# EAGLE design ESP32S3_LoRa_ Camera_Board_050426 (EAGLE 6.5.0)
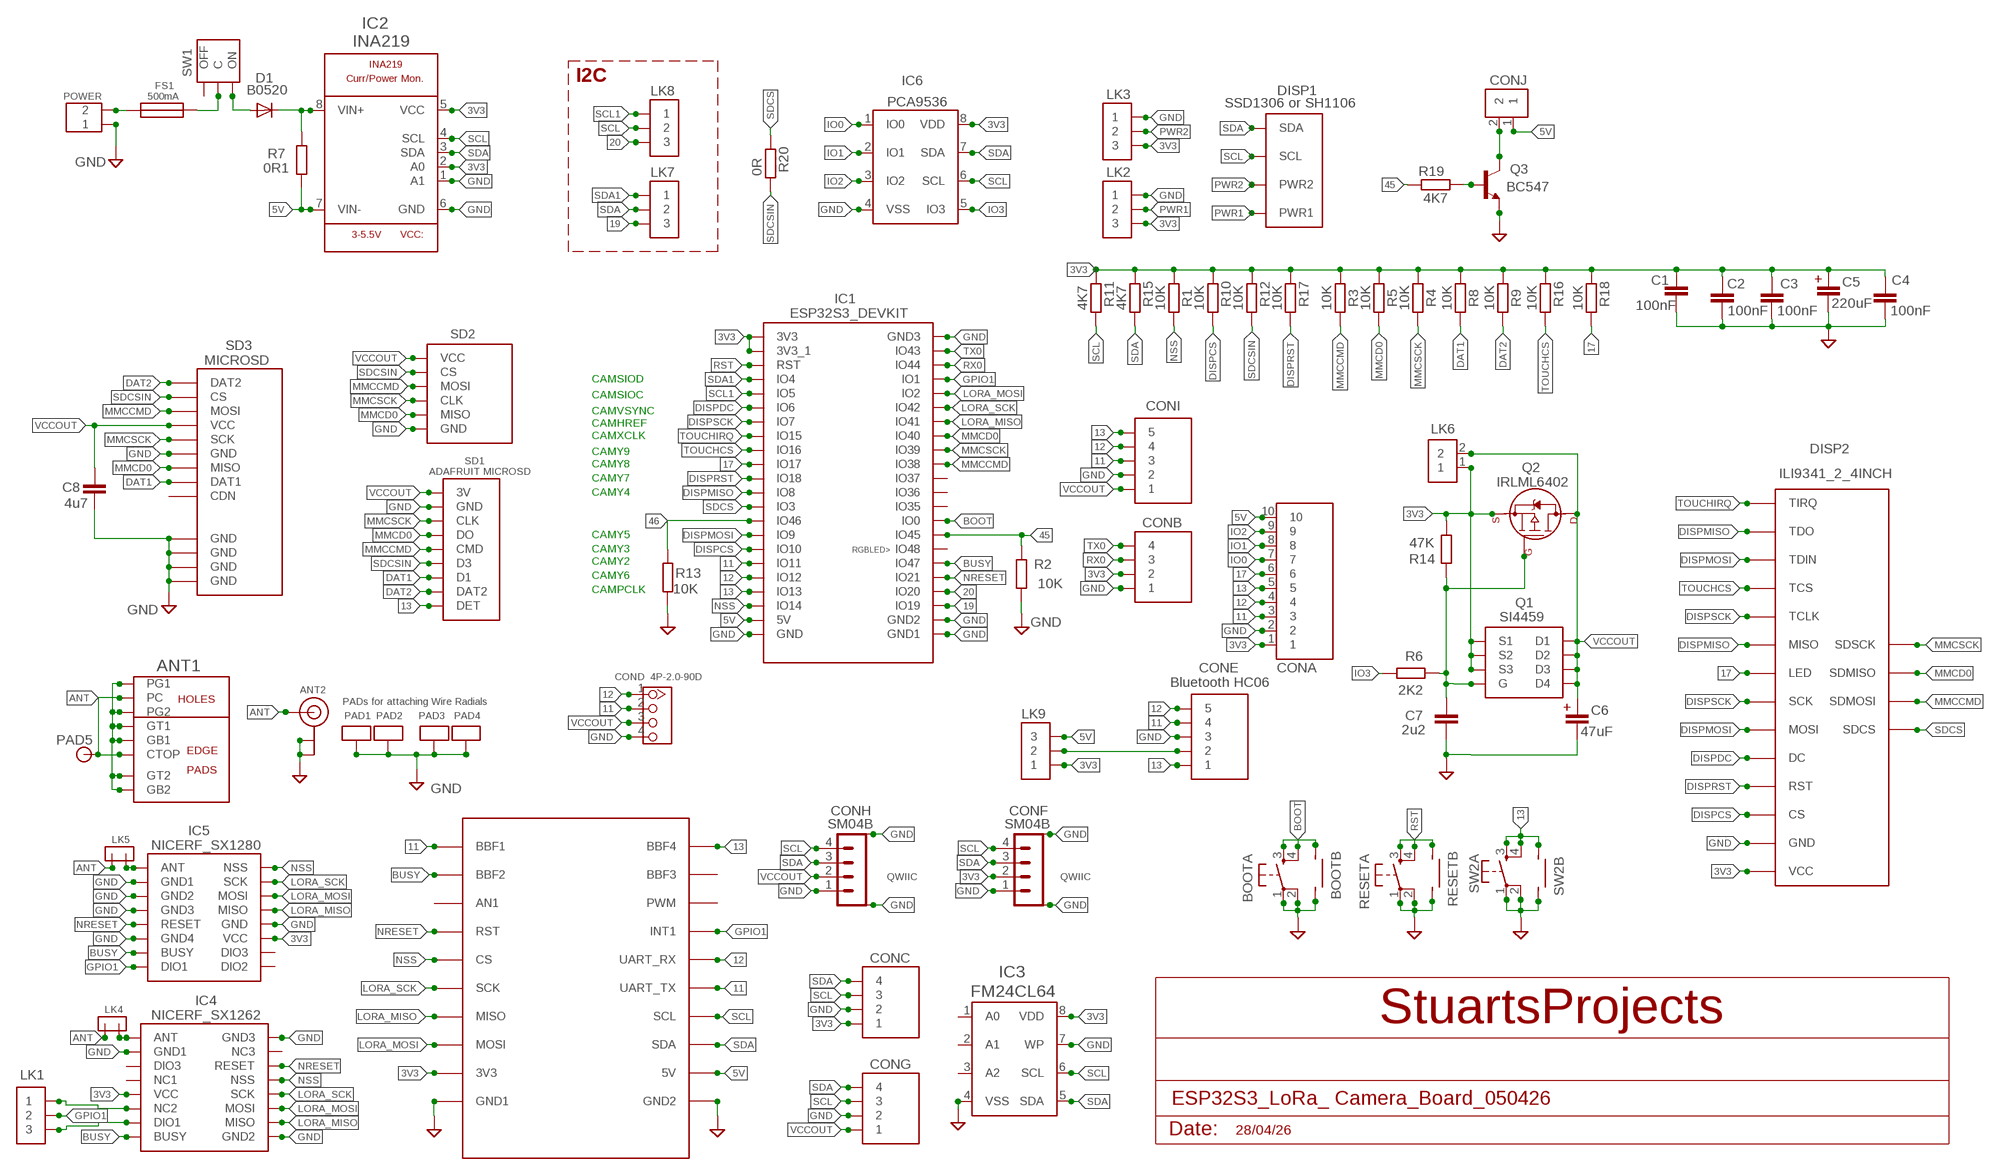
[diagram p0: schematic, sheet 1]

## Parts
ANT1  CUSTOMSMA  [CUSTOMSMA]
ANT2  ANTENNA_U.FL  [U.FL]
BOOTA  DTS-6  [DTS-6]
BOOTB  SMALLSMTSWITCH  [SMALLSMTSWITCH]
C1  100nF  MEDIUM_CERAMIC_DISK  [MEDIUM_CERAMIC_DISC]
C2  100nF  MEDIUM_CERAMIC_DISK  [MEDIUM_CERAMIC_DISC]
C3  100nF  MEDIUM_CERAMIC_DISK  [MEDIUM_CERAMIC_DISC]
C4  100nF  MEDIUM_CERAMIC_DISK  [MEDIUM_CERAMIC_DISC]
C5  220uF  2.5MM_SPACEING_CAPACITOR  [2.5MM_SPACING_CAPACITOR]
C6  47uF  2.5MM_SPACEING_CAPACITOR  [2.5MM_SPACING_CAPACITOR]
C7  2u2  C-EUC1206  [C1206]
C8  4u7  C-EUC1206  [C1206]
CONA  10X1  [10X1]
CONB  4X1  [4X1]
CONC  4X1  [4X1]
COND  4P-2.0-90D  GROVE-CONNECTOR-DIP-90D(4P-2.0)  [HW4-2.0-90D]
CONE  5X1  [5X1]
CONF  SM04B  SM04B-SRSS-TB  [SM04B-SRSS-TB]
CONG  4X1  [4X1]
CONH  SM04B  SM04B-SRSS-TB  [SM04B-SRSS-TB]
CONI  5X1  [5X1]
CONJ  2X1  [2X1]
D1  B0520  DIODE-SOD123  [SOD123]
DISP1  SSD1306 or SH1106  SMALL_OLED2  [SMALL_OLED2]
DISP2  ILI9341_2_4INCH  [ILI9341_2_4_INCH]
FS1  500mA  SMALL_POLYFUSE  [SMALL_POLYFUSE]
IC1  ESP32S3_DEVKIT  ESP32S3_DEVKIT_DEFAULT  [ESP32S3_DEVKIT]
IC2  INA219  INA219_SOIC8  [SOIC8]
IC3  FM24CL64  24L256SOIC2  [SOIC_2]
IC4  NICERF_SX1262  [NICERF_SX1262]
IC5  NICERF_SX1280  [NICERF_SX1280]
IC6  PCA9536  PCA9563SOIC8  [SOIC08]
LK1  3X1_SMALL_ROUND_PAD  [3X1_SMALL_ROUND_PAD]
LK2  3X1  [3X1]
LK3  3X1  [3X1]
LK4  2PINMICROHEADER  [2PINMICROHEADER]
LK5  2PINMICROHEADER  [2PINMICROHEADER]
LK6  2X1_SMALL_ROUND_PAD  [2X1_SMALL_ROUND_PAD]
LK7  3X1  [3X1]
LK8  3X1  [3X1]
LK9  3X1  [3X1]
MB1  BBFRIENDY2  [PCB_SOCKET_BBFRIENDLY2]
PAD1  ANTPAD2  [ANTPAD2]
PAD2  ANTPAD2  [ANTPAD2]
PAD3  ANTPAD2  [ANTPAD2]
PAD4  ANTPAD2  [ANTPAD2]
PAD5  PAD_ROUND_0_6MM_HOLE  [PAD-ROUND_0_6MM_HOLE]
POWER  SCREWTERMINAL_2WAY_0_1_INCH  [SCREWTERMINAL_2WAY_0_1_INCH]
Q1  SI4459  [SOIC_2]
Q2  IRLML6402  IRLFL6402  [SOT23]
Q3  BC547  BC547INLINE  [TO92-CBE]
R1  10K  R-EU_R1206  [R1206]
R2  10K  R-EU_R1206  [R1206]
R3  10K  R-EU_R1206  [R1206]
R4  10K  R-EU_R1206  [R1206]
R5  10K  R-EU_R1206  [R1206]
R6  2K2  R-EU_R1206  [R1206]
R7  0R1  R-EU_R1206  [R1206]
R8  10K  R-EU_R1206  [R1206]
R9  10K  R-EU_R1206  [R1206]
R10  10K  R-EU_R1206  [R1206]
R11  4K7  R-EU_R1206  [R1206]
R12  10K  R-EU_R1206  [R1206]
R13  10K  R-EU_R1206  [R1206]
R14  47K  R-EU_R1206  [R1206]
R15  4K7  R-EU_R1206  [R1206]
R16  10K  R-EU_R1206  [R1206]
R17  10K  R-EU_R1206  [R1206]
R18  10K  R-EU_R1206  [R1206]
R19  4K7  R-EU_M1206  [M1206]
R20  0R  R-EU_R1206  [R1206]
RESETA  DTS-6  [DTS-6]
RESETB  SMALLSMTSWITCH  [SMALLSMTSWITCH]
SD1  ADAFRUIT MICROSD  ADAFRUIT_MICROSD_DEFAULT  [ADAFRUIT_MICROSD]
SD2  MICROSD_BREAKOUT2_DEFAULT  [MICROSD_BREAKOUT2]
SD3  MICROSD  MICROSD_PP  [MICROSD_PP]
SW1  PCB_SLIDE_SWITCH2  [SK12F14]
SW2A  DTS-6  [DTS-6]
SW2B  SMALLSMTSWITCH  [SMALLSMTSWITCH]

## Nets
3V3 [POWER]: C1.2 C2.2 C3.2 C4.2 C5.+ CONA.1 CONB.2 CONC.1 CONF.2 DISP2.VCC IC1.3V3 IC1.3V3_1 IC2.2(A0) IC2.5(VCC) IC3.8(VDD) IC4.P$5(VCC) IC5.P$3(VCC) IC6.8(VDD) LK2.3 LK3.3 LK6.1 LK9.1 MB1.3V3 Q1.1(S1) Q1.2(S2) Q1.3(S3) Q2.2(S1) R1.2 R3.2 R4.2 R5.2 R8.2 R9.2 R10.2 R11.2 R12.2 R14.1 R15.2 R16.2 R17.2 R18.2
5V [POWER]: CONA.10 CONJ.1 IC1.5V IC2.7(VIN-) LK9.3 MB1.5V R7.1
11: CONA.3 COND.2 CONE.4 CONI.3 IC1.11(IO11) MB1.BBF1 MB1.TX(UART_TX)
12: CONA.4 COND.1 CONE.5 CONI.4 IC1.12(IO12) MB1.RX(UART_RX)
13: CONA.5 CONE.1 CONI.5 IC1.13(IO13) MB1.BBF4 SD1.P$9(DET) SW2A.3 SW2A.4 SW2B.P$4
17: CONA.6 DISP2.LED IC1.17(IO17) R18.1
19: IC1.19(IO19) LK7.3
20: IC1.20(IO20) LK8.3
45: IC1.45(IO45) R2.1 R19.2
46: IC1.46(IO46) R13.2
ANT [Antenna]: ANT1.CTOP ANT1.PC ANT2.3(SIGNAL) LK4.1 LK5.1 PAD5.P$1
BOOT: BOOTA.3 BOOTA.4 BOOTB.P$4 IC1.0(IO0)
BUSY: IC1.47(IO47) IC4.P$8(BUSY) IC5.P$15(BUSY) MB1.BBF2
DAT1: R8.1 SD1.P$7(D1) SD3.DAT1
DAT2: R9.1 SD1.P$8(DAT2) SD3.DAT2
DISPCS: DISP2.CS IC1.10(IO10) R10.1
DISPDC: DISP2.DC IC1.6(IO6)
DISPMISO: DISP2.MISO DISP2.TDO IC1.8(IO8)
DISPMOSI: DISP2.MOSI DISP2.TDIN IC1.9(IO9)
DISPRST: DISP2.RST IC1.18(IO18) R17.1
DISPSCK: DISP2.SCK DISP2.TCLK IC1.7(IO7)
GND [POWER]: ANT1.G1 ANT1.G2 ANT1.GB1 ANT1.GB2 ANT1.GT1 ANT1.GT2 ANT2.1(GND) ANT2.2(GND) BOOTA.1 BOOTA.2 BOOTB.P$3 C1.1 C2.1 C3.1 C4.1 C5.- C6.- C7.2 C8.2 CONA.2 CONB.1 CONC.2 COND.4 CONE.3 CONF.1 CONF.M1 CONF.M2 CONG.2 CONH.1 CONH.M1 CONH.M2 CONI.2 DISP2.GND IC1.GND IC1.GND1 IC1.GND2 IC1.GND3 IC2.1(A1) IC2.6(GND) IC3.4(VSS) IC3.7(WP) IC4.P$2(GND1) IC4.P$9(GND2) IC4.P$16(GND3) IC5.P$4(GND) IC5.P$10(GND1) IC5.P$11(GND2) IC5.P$12(GND3) IC5.P$14(GND4) IC6.4(VSS) LK2.1 LK3.1 MB1.GND1(GND2) MB1.GND2(GND1) PAD1.P$1 PAD2.P$1 PAD3.P$1 PAD4.P$1 POWER.P$1 Q3.E R2.2 R13.1 RESETA.1 RESETA.2 RESETB.P$3 SD1.P$2(GND) SD2.GND SD3.GND SD3.GND@1(GND) SD3.GND@2(GND) SD3.GND@3(GND) SD3.GND@4(GND) SW2A.1 SW2A.2 SW2B.P$3
GPIO1: IC1.1(IO1) IC5.P$16(DIO1) LK1.2 MB1.INT(INT1)
IO0: CONA.7 IC6.1(IO0)
IO1: CONA.8 IC6.2(IO1)
IO2: CONA.9 IC6.3(IO2)
IO3: IC6.5(IO3) R6.2
LORA_MISO: IC1.41(IO41) IC4.P$10(MISO) IC5.P$5(MISO) MB1.MISO
LORA_MOSI: IC1.2(IO2) IC4.P$11(MOSI) IC5.P$6(MOSI) MB1.MOSI
LORA_SCK: IC1.42(IO42) IC4.P$12(SCK) IC5.P$7(SCK) MB1.SCK
MMCCMD: DISP2.SDMOSI IC1.38(IO38) R3.1 SD1.P$5(CMD) SD2.MOSI SD3.MOSI
MMCD0: DISP2.SDMISO IC1.40(IO40) R5.1 SD1.P$4(DO) SD2.MISO SD3.MISO
MMCSCK: DISP2.SDSCK IC1.39(IO39) R4.1 SD1.P$3(CLK) SD2.SCK(CLK) SD3.SCK
N$1: C7.1 Q1.4(G) Q2.1(G1) R6.1 R14.2
N$2: IC4.P$6(NC2) LK1.1
N$3 [Antenna]: IC5.P$9(ANT) LK5.2
N$4: IC4.P$7(DIO1) LK1.3
N$6 [Antenna]: IC4.P$1(ANT) LK4.2
N$7 [POWER]: D1.C IC2.8(VIN+) R7.2
N$8 [POWER]: FS1.P$1 POWER.P$2
N$10 [POWER]: D1.A SW1.ON
N$13: Q3.B R19.1
N$14 [POWER]: FS1.P$2 SW1.C
N$17 [POWER]: CONJ.2 Q3.C
N$18 [POWER]: CONE.2 LK9.2
NRESET: IC1.21(IO21) IC4.P$14(RESET) IC5.P$13(RESET) MB1.RST
NSS: IC1.14(IO14) IC4.P$13(NSS) IC5.P$8(NSS) MB1.CS R1.1
PWR1 [POWER]: DISP1.1(PWR1) LK2.2
PWR2 [POWER]: DISP1.2(PWR2) LK3.2
RST: IC1.RST RESETA.3 RESETA.4 RESETB.P$4
RX0: CONB.3 IC1.44(IO44)
SCL: CONC.3 CONF.4 CONG.3 CONH.4 DISP1.SCL IC2.4(SCL) IC3.6(SCL) IC6.6(SCL) LK8.2 MB1.SCL R11.1
SCL1: IC1.5(IO5) LK8.1
SDA: CONC.4 CONF.3 CONG.4 CONH.3 DISP1.SDA IC2.3(SDA) IC3.5(SDA) IC6.7(SDA) LK7.2 MB1.SDA R15.1
SDA1: IC1.4(IO4) LK7.1
SDCS: DISP2.SDCS IC1.3(IO3) R20.2
SDCSIN: R12.1 R20.1 SD1.P$6(D3) SD2.CS SD3.CS
TOUCHCS: DISP2.TCS IC1.16(IO16) R16.1
TOUCHIRQ: DISP2.TIRQ IC1.15(IO15)
TX0: CONB.4 IC1.43(IO43)
VCCOUT [POWER]: C6.+ C8.1 COND.3 CONG.1 CONH.2 CONI.1 LK6.2 Q1.5(D4) Q1.6(D3) Q1.7(D2) Q1.8(D1) Q2.3(D1) SD1.P$1(3V) SD2.VCC SD3.VCC
Unconnected: IC1.35(IO35) IC1.36(IO36) IC1.37(IO37) IC1.48(IO48) IC3.1(A0) IC3.2(A1) IC3.3(A2) IC4.P$3(DIO3) IC4.P$4(NC1) IC4.P$15(NC3) IC5.P$1(DIO2) IC5.P$2(DIO3) MB1.AN1 MB1.BBF3 MB1.PWM SD3.CDN SW1.OFF

## Notes on the sheet
- I2C
- CAMSIOD
- CAMSIOC
- CAMVSYNC
- CAMHREF
- CAMXCLK
- CAMY9
- CAMY8
- CAMY7
- CAMY4
- CAMY5
- CAMY3
- CAMY2
- CAMY6
- CAMPCLK
- Bluetooth HC06
- PADs for attaching Wire Radials
- QWIIC | QWIIC
- 28/04/26

## Library data of the parts
ANT1 = con-coax:CUSTOMSMA
ANT2 = adafruit:ANTENNA_U.FL: U.FL Antenna Connector
BOOTA RESETA SW2A = switch-tact:DTS-6
BOOTB RESETB SW2B = LMA2:SMALLSMTSWITCH
C1-C4 = LMA2:MEDIUM_CERAMIC_DISK
C5 C6 = LMA2:2.5MM_SPACEING_CAPACITOR
C7 C8 = resistor:C-EU: CAPACITOR, European symbol
CONA = My_Pin_Headers:10X1
CONB CONC CONG = My_Pin_Headers:4X1
COND = OPL_Connector:GROVE-CONNECTOR-DIP-90D(4P-2.0): 320110034
CONE CONI = My_Pin_Headers:5X1
CONF CONH = con-JST2:SM04B-SRSS: JST SH series header 1.00mm pitch disconnectable crimp style connectors, horizontal (side entry type), 4 pins
CONJ = My_Pin_Headers:2X1
D1 = diode:DIODE-: DIODE
DISP1 = LMA2:SMALL_OLED2
DISP2 = LMA2:ILI9341_2_4INCH
FS1 = LMA2:SMALL_POLYFUSE
IC1 = LMA2:ESP32S3_DEVKIT
IC2 = INA219:INA219: INA219 - I2C Current/Power Monitor Voltage Range: 0-26V Accuracy: 0.5% Temperature: -40°C - 125°C Check availability <https://pricing.snapeda.com/parts/INA219/Texas%20Instruments/view-part?ref=eda>
IC3 = LMA2:24L256
IC4 = LMA2:NICERF_SX1262
IC5 = LMA2:NICERF_SX1280
IC6 = LMA2:PCA9563
LK1 = My_Pin_Headers:3X1_SMALL_ROUND_PAD
LK2 LK3 LK7-LK9 = My_Pin_Headers:3X1
LK4 LK5 = LMA2:2PINMICROHEADER
LK6 = My_Pin_Headers:2X1_SMALL_ROUND_PAD
MB1 = My_Mikrobus:BBFRIENDY2
PAD1-PAD4 = LMA2:ANTPAD2
PAD5 = pads:PAD_ROUND
POWER = LMA2:SCREWTERMINAL_2WAY_0_1_INCH
Q1 = LMA2:SI4459
Q2 = LMA2:IRLFL6402
Q3 = transistor-npn:BC547*: NPN Transistor
R1-R20 = resistor:R-EU_: RESISTOR, European symbol
SD1 = LMA2:ADAFRUIT_MICROSD
SD2 = LMA2:MICROSD_BREAKOUT2
SD3 = DE1594-v2:MICROSD_PP
SW1 = LMA2:PCB_SLIDE_SWITCH2

## Net classes
0 default: width 0.203 mm, drill 0.305 mm
1 POWER: width 0.635 mm, drill 0.305 mm
2 VDD: width 0.635 mm, drill 0.305 mm
3 Antenna: width 0.381 mm, drill 0.305 mm

## Board
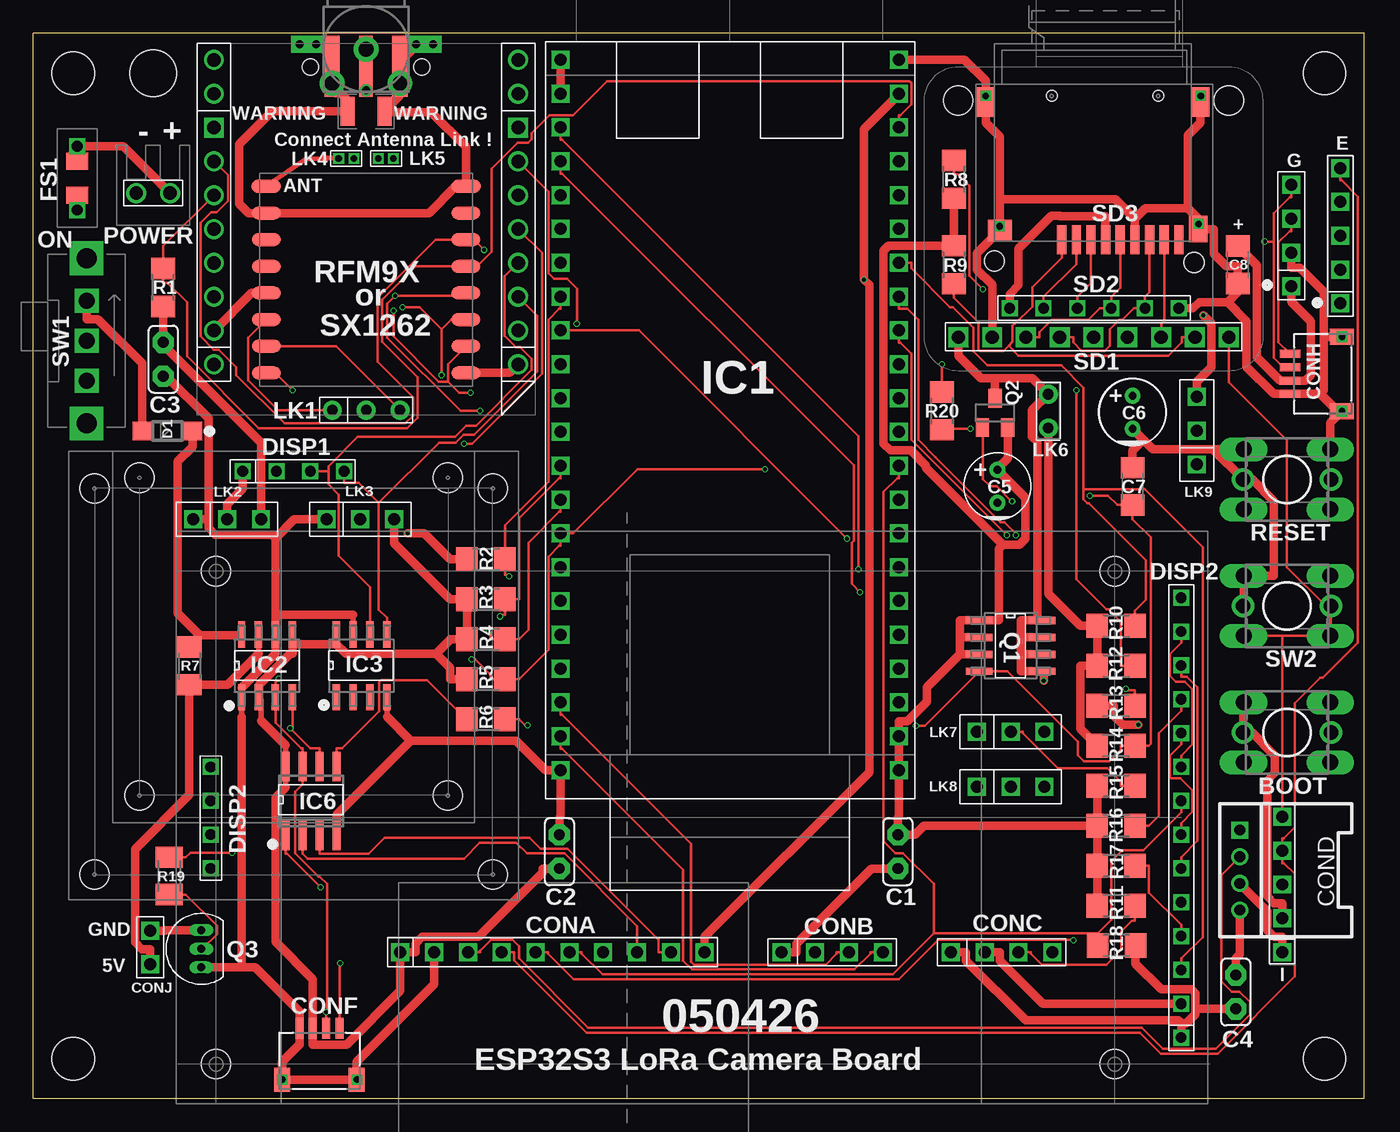
[diagram p1: board, top side]
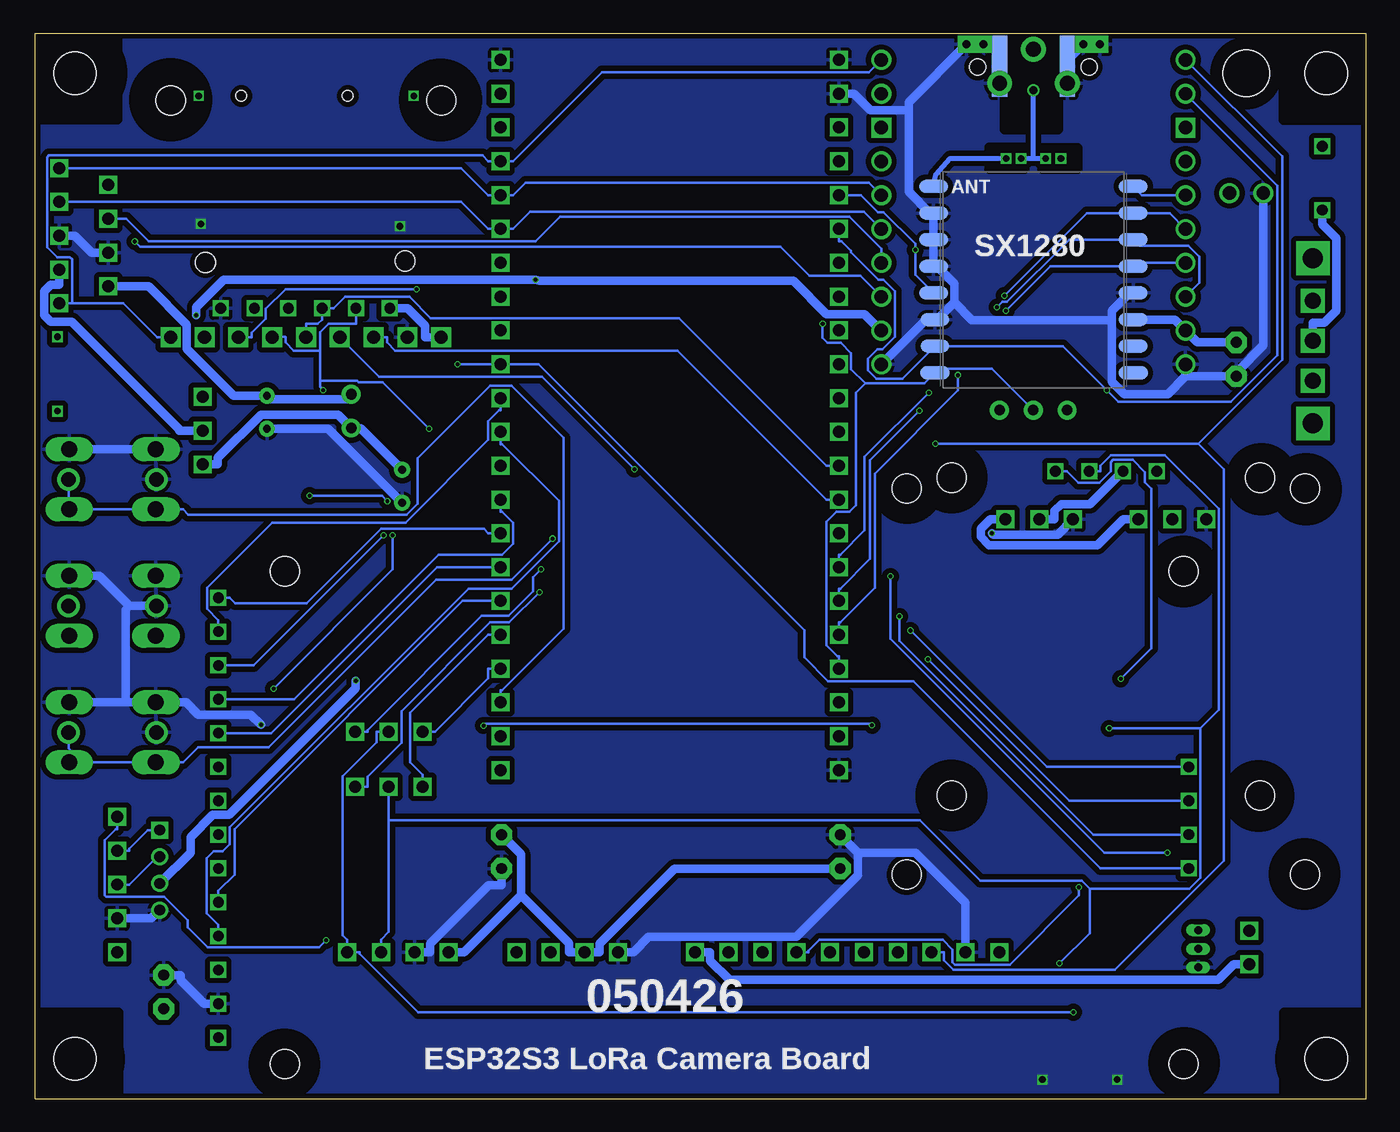
[diagram p2: board, bottom side, seen from below]

Size 100 x 80 mm. Coordinates in mm from the lower left corner, seen from the top.
Outline: 0,0 0,80 100,80 100,0 0,0
Copper layers (1*16): Top 0.035559375mm / dielectric 1.6mm / Bottom 0.035559375mm
Design rules "jlcpcb2layer_Stuarts": minimum track width 5mil, minimum drill 12mil, track to track 6mil, track to pad 6mil, pad to pad 6mil, via to via 6mil, smd to smd 6mil, copper to edge 8mil, drill to drill 6mil, minimum pad ring 5mil, minimum via ring 3mil, stop-mask expansion 2.5mil, vias tented up to drill 1000mil, thermal gap 10mil
Holes 3.2 mm at 3,3 97,3 3,77 97,77
Holes 1.2 mm at 20.81,77.46 29.2,77.46
Holes 3.5 mm at 9,77
Holes 2.2 mm at 7.98,46.62 4.6,45.82 13.73,39.6 31.14,46.62 34.52,45.82 34.52,16.82 4.6,16.82 13.73,2.6 81.24,2.6 81.23,39.6 7.98,22.77 31.15,22.77
tRestrict: area 11.6,0.6 to 15.8,4.8; area 79.1,0.5 to 83.3,4.7; area 79.2,37.4 to 83.3,41.5; area 6.9,74.9 to 11,79; area 5.8,44.5 to 10,48.6; area 2.4,43.7 to 6.6,47.9; area 29.1,44.5 to 33.2,48.7; area 32.4,43.7 to 36.6,47.9; area 2.6,14.8 to 6.8,18.9; area 6,20.7 to 10.1,24.8; area 32.4,14.8 to 36.6,18.9; area 29.1,20.7 to 33.3,24.9; 6 more areas
bRestrict: area 11.6,37.5 to 15.8,41.7; area 11.6,0.6 to 15.8,4.7; area 79.2,0.5 to 83.4,4.7; area 79.2,37.5 to 83.3,41.6; area 67,72.5 to 72,77.5; area 7,74.9 to 11.1,79.1; area 5.8,44.4 to 10,48.6; area 2.4,43.7 to 6.6,47.8; area 29.1,44.5 to 33.2,48.7; area 32.4,43.8 to 36.6,48; area 6,20.6 to 10.2,24.8; area 2.6,14.8 to 6.7,18.9; 20 more areas

### Footprints (pad centres in the part's own frame; a part is rotated, then mirrored left to right if it is on the bottom)
CUSTOMSMA = smd 4.572 x 1.016: CTOP -1.27,0 | drill 1.1 pad 1.85: G1 -2.55,2.55; G2 -2.55,-2.55; PC 0,0 | smd 4.572 x 1.143 bottom: GB1 -1.27,2.54; GB2 -1.27,-2.54 | smd 4.572 x 1.143: GT1 -1.27,2.54; GT2 -1.27,-2.54
U.FL = smd 2.2 x 1.05: 1 0,1.375; 2 0,-1.375 | smd 0.8 x 1: 3 1.525,0
DTS-6 = drill 1.2 long: 1 -3.25,2.25; 2 3.25,2.25; 3 -3.25,-2.25; 4 3.25,-2.25
SMALLSMTSWITCH = drill 1.1 pad 1.7: P$3 -3.3,0; P$4 3.3,0
MEDIUM_CERAMIC_DISC = drill 0.813 pad 1.6 octagon: 1 -1.27,0; 2 1.27,0
2.5MM_SPACING_CAPACITOR = drill 0.6 pad 1.2: + 0,1.25; - 0,-1.25
C1206 = smd 1.6 x 1.8: 1 -1.4,0; 2 1.4,0
10X1 = drill 0.9 square: 1 -11.43,0; 2 -8.89,0; 3 -6.35,0; 4 -3.81,0; 5 -1.27,0; 6 1.27,0; 7 3.81,0; 8 6.35,0; 9 8.89,0; 10 11.43,0
4X1 = drill 0.9 square: 1 -3.81,0; 2 -1.27,0; 3 1.27,0; 4 3.81,0
HW4-2.0-90D = drill 0.8 pad 1.27 square: 1 -3,0 | drill 0.8 pad 1.27: 2 -1,0; 3 1,0; 4 3,0
5X1 = drill 0.9 square: 1 -5.08,0; 2 -2.54,0; 3 0,0; 4 2.54,0; 5 5.08,0
SM04B-SRSS-TB = smd 0.6 x 1.55: 1 1.5,0; 2 0.5,0; 3 -0.5,0; 4 -1.5,0 | smd 1.2 x 1.8: M1 2.8,3.875; M2 -2.8,3.875
2X1 = drill 0.9 square: 1 -1.27,0; 2 1.27,0
SOD123 = smd 1.4 x 1.4: A 1.9,0; C -1.9,0
SMALL_OLED2 = drill 0.8 square: 1 -3.83,-1.51; 2 -1.29,-1.51; SCL 1.25,-1.51; SDA 3.79,-1.51
ILI9341_2_4_INCH = drill 0.8 square: CS -11.43,0; DC -6.35,0; GND -13.97,0; LED 1.27,0; MISO 3.81,0; MOSI -3.81,0; RST -8.89,0; SCK -1.27,0; SDCS -3.81,72.9; SDMISO 1.27,72.9; SDMOSI -1.27,72.9; SDSCK 3.81,72.9; TCLK 6.35,0; TCS 8.89,0; TDIN 11.43,0; TDO 13.97,0; TIRQ 16.51,0; VCC -16.51,0
SMALL_POLYFUSE = drill 0.8 square: P$1 -2.4,0; P$2 2.4,0 | smd 1.27 x 1.635: P$3 -1.27,0; P$4 1.27,0
ESP32S3_DEVKIT = drill 0.9 square: 0 12.7,-35.56; 1 12.7,-10.16; 2 12.7,-12.7; 3 -12.7,-33.02; 3V3 -12.7,-2.54; 3V3_1 -12.7,-5.08; 4 -12.7,-10.16; 5 -12.7,-12.7; 5V -12.7,-53.34; 6 -12.7,-15.24; 7 -12.7,-17.78; 8 -12.7,-30.48; 9 -12.7,-38.1; 10 -12.7,-40.64; 11 -12.7,-43.18; 12 -12.7,-45.72; 13 -12.7,-48.26; 14 -12.7,-50.8; 15 -12.7,-20.32; 16 -12.7,-22.86; 17 -12.7,-25.4; 18 -12.7,-27.94; 19 12.7,-50.8; 20 12.7,-48.26; 21 12.7,-45.72; 35 12.7,-33.02; 36 12.7,-30.48; 37 12.7,-27.94; 38 12.7,-25.4; 39 12.7,-22.86; 40 12.7,-20.32; 41 12.7,-17.78; 42 12.7,-15.24; 43 12.7,-5.08; 44 12.7,-7.62; 45 12.7,-38.1; 46 -12.7,-35.56; 47 12.7,-43.18; 48 12.7,-40.64; GND -12.7,-55.88; GND1 12.7,-55.88; GND2 12.7,-53.34; GND3 12.7,-2.54; RST -12.7,-7.62
SOIC8 = smd 1.981 x 0.559: 1 -2.362,1.905; 2 -2.362,0.635; 3 -2.362,-0.635; 4 -2.362,-1.905; 5 2.362,-1.905; 6 2.362,-0.635; 7 2.362,0.635; 8 2.362,1.905
SOIC_2 = smd 1.981 x 0.559: 1 -2.362,1.905; 2 -2.362,0.635; 3 -2.362,-0.635; 4 -2.362,-1.905; 5 2.362,-1.905; 6 2.362,-0.635; 7 2.362,0.635; 8 2.362,1.905
NICERF_SX1262 = smd 2.2 x 1: P$1 -7.5,7.5; P$16 7.5,7.5 | smd 2.159 x 0.965: P$2 -7.5,5.5; P$3 -7.5,3.5; P$4 -7.5,1.5; P$5 -7.5,-0.5; P$6 -7.5,-2.5; P$7 -7.5,-4.5; P$8 -7.5,-6.5; P$9 7.5,-6.5; P$10 7.5,-4.5; P$11 7.5,-2.5; P$12 7.5,-0.5; P$13 7.5,1.5; P$14 7.5,3.5; P$15 7.5,5.5
NICERF_SX1280 = smd 2.2 x 1: P$1 -7.5,7.5; P$16 7.4,7.5 | smd 2.159 x 0.965: P$2 -7.5,5.5; P$3 -7.5,3.5; P$4 -7.5,1.5; P$5 -7.5,-0.5; P$6 -7.5,-2.5; P$7 -7.5,-4.5; P$8 -7.5,-6.5; P$9 7.5,-6.5; P$10 7.5,-4.5; P$11 7.5,-2.5; P$12 7.5,-0.5; P$13 7.5,1.5; P$14 7.4,3.5; P$15 7.4,5.5
SOIC08 = smd 0.6 x 2.2: 1 -1.905,-2.6; 2 -0.635,-2.6; 3 0.635,-2.6; 4 1.905,-2.6; 5 1.905,2.6; 6 0.635,2.6; 7 -0.635,2.6; 8 -1.905,2.6
3X1_SMALL_ROUND_PAD = drill 0.8 pad 1.422: 1 -2.54,0; 2 0,0; 3 2.54,0
3X1 = drill 0.9 square: 1 -2.54,0; 2 0,0; 3 2.54,0
2PINMICROHEADER = drill 0.5 pad 0.8 square: 1 0,0.575; 2 0,-0.56
2X1_SMALL_ROUND_PAD = drill 0.8 pad 1.422: 1 -1.27,0; 2 1.27,0
PCB_SOCKET_BBFRIENDLY2 = drill 1: 3V3 -11.43,5.08; 5V 11.43,5.08; BBF1 -11.43,25.4; BBF2 -11.43,22.86; BBF3 11.43,22.86; BBF4 11.43,25.4; CS -11.43,15.24; GND1 -11.43,2.54; GND2 11.43,2.54; INT 11.43,17.78; MISO -11.43,10.16; MOSI -11.43,7.62; RST -11.43,17.78; RX 11.43,15.24; SCK -11.43,12.7; SCL 11.43,10.16; SDA 11.43,7.62; TX 11.43,12.7 | drill 1 square: AN1 -11.43,20.32; PWM 11.43,20.32
ANTPAD2 = drill 0.6 pad 1.27 square: P$1 0,0
PAD-ROUND_0_6MM_HOLE = drill 0.6: P$1 0,0
SCREWTERMINAL_2WAY_0_1_INCH = drill 1: P$1 -1.27,0; P$2 1.27,0
SOT23 = smd 1 x 1.4: 1 -0.95,-1.1; 2 0.95,-1.1; 3 0,1.1
TO92-CBE = drill 0.6 long: B 0,0; C 1.4,0; E -1.4,0
R1206 = smd 1.6 x 1.803: 1 -1.422,0; 2 1.422,0
M1206 = smd 1.6 x 2: 1 -1.4,0; 2 1.4,0
ADAFRUIT_MICROSD = drill 1 square: P$1 2.54,2.54; P$2 5.08,2.54; P$3 7.62,2.54; P$4 10.16,2.54; P$5 12.7,2.54; P$6 15.24,2.54; P$7 17.78,2.54; P$8 20.32,2.54; P$9 22.86,2.54 | hole 2.2: 2.54,20.32; 22.86,20.32
MICROSD_BREAKOUT2 = drill 0.8 square: CS 3.81,0; GND -6.35,0; MISO -3.81,0; MOSI 1.27,0; SCK -1.27,0; VCC 6.35,0 | hole 1.5: -7.5,-3.44; 7.5,-3.54
MICROSD_PP = smd 2.2 x 0.7: CDN -0.2,-4.95; CS -0.2,2.75; DAT1 -0.2,-3.85; DAT2 -0.2,3.85; GND -0.2,-1.65; MISO -0.2,-2.75; MOSI -0.2,1.65; SCK -0.2,-0.55; VCC -0.2,0.55 | smd 1.6 x 1.8: GND@1 0.5,8.5 | smd 2.2 x 1.4: GND@2 10.15,9.55; GND@4 10.15,-6.55 | smd 2 x 1.4: GND@3 0.6,-6.4 | hole 0.8: 10.6,4.6; 10.6,-3.4
SK12F14 = drill 1.2 pad 1.778 square: C 0,0; OFF 3,0; ON -3,0 | drill 1.5 pad 2.54 square: P$4 6.2,0; P$5 -6.2,0

### Placement (x,y rotation side)
ANT1  25,78.8 90 top
ANT2  25,74.14 90 top
BOOTA  94.18,27.5 0 top
BOOTB  94.18,27.5 0 top
C1  64.95,18.55 90 top
C2  39.52,18.55 270 top
C3  9.76,55.52 90 top
C4  90.33,8.01 270 top
C5  72.41,45.98 0 top
C6  82.58,51.54 0 top
C7  82.58,45.98 90 top
C8  90.5,62.62 270 top
CONA  39,11 0 top
CONB  60,11 0 top
CONC  72.74,11 0 top
COND  90.63,17.16 270 top
CONE  98.17,64.8 90 top
CONF  21.5,5.29 180 top
CONG  94.5,64.8 90 top
CONH  94.42,54.42 270 top
CONI  93.84,16.08 90 top
CONJ  8.79,11.35 90 top
D1  10.07,50.14 180 top
DISP1  19.56,48.62 0 top
DISP2  86.23,21.1 90 top
FS1  3.3,69.12 270 top
IC1  52.32,22.13 180 top
IC2  17.56,32.5 90 top
IC3  24.66,32.5 90 top
IC4  25,61 0 top
IC5  25,62 180 bottom
IC6  20.87,22.35 0 top
LK1  25.01,51.7 0 top
LK2  14.56,43.5 0 top
LK3  24.56,43.5 0 top
LK4  23.5,70.6 270 top
LK5  26.5,70.6 90 top
LK6  76.24,51.63 90 top
LK7  73.42,27.56 0 top
LK8  73.42,23.41 0 top
LK9  87.41,50.16 90 top
MB1  25,52.6 0 top
PAD1  21.26,79.18 0 top
PAD2  20,79.18 0 top
PAD3  30.02,79.18 0 top
PAD4  28.75,79.18 0 top
PAD5  25,75.71 270 top
POWER  9,68 0 top
Q1  73.42,34 0 top
Q2  72.25,51.49 0 top
Q3  12.63,11.25 90 top
R1  9.76,60.91 270 top
R2  34,40.5 180 top
R3  34,37.5 180 top
R4  34,34.5 180 top
R5  34,31.5 180 top
R6  34,28.5 180 top
R7  11.73,32.5 90 top
R8  69.16,69.03 270 top
R9  69.16,62.62 90 top
R10  81.34,35.5 180 top
R11  81.34,14.5 180 top
R12  81.34,32.5 180 top
R13  81.34,29.5 0 top
R14  81.34,26.5 0 top
R15  81.34,23.5 180 top
R16  81.34,20.5 180 top
R17  81.34,17.5 180 top
R18  81.38,11.5 0 top
R19  10.21,16.72 90 top
R20  68.25,51.65 90 top
RESETA  94.18,46.5 0 top
RESETB  94.18,46.5 0 top
SD1  66.95,54.63 0 top
SD2  79.7,59.35 180 top
SD3  81.1,64.7 90 top
SW1  4,56.9 270 top
SW2A  94.18,37 0 top
SW2B  94.18,37 0 top

### Tracks (layer width: path | path; a pad name or v marks a point on that pad's centre or on a via)
3V3
  Top 0.406: 18.96,23.38 IC6.8 18.96,26.52 | IC2.5 19.46,34.13 | IC3.8 22.75,34.13 | IC2.2 16.97,30.14 17.1,29.96 17.1,28.39
  Top 0.635: CONC.1 70.08,11 70.08,10.36 74.55,5.88 86,5.88 86.23,5.66 | 87.3,6.74 87.3,6.33 86.63,5.66 86.23,5.66 | 87.3,6.74 87.3,7.93 87.03,8.2 84.73,8.2 82.8,10.13 R18.2 | 87.3,6.74 89.06,6.74 C4.2 | DISP2.VCC 86.23,5.66 | 79.28,20.5 66.9,20.5 66.22,19.82 C1.2 64.95,21.09 65.02,21.16 IC1.3V3 IC1.3V3_1 65.02,28.36 65.66,28.36 65.67,28.36 67.14,29.82 67.14,30.91 69.6,33.37 | R15.2 79.92,21.14 79.28,20.5 | C2.2 38.25,17.28 38.25,16.96 33.43,12.14 29.22,12.14 28.71,11.64 28.71,11 CONA.1 27.57,8.09 23.53,4.04 21,4.04 21,5.07 CONF.2 21,8.97 18.2,11.78 18.2,22.61 18.96,23.38 | LK3.3 27.1,42.35 27.1,41.71 31.31,37.5 R3.2 R4.2 31.31,34.5 31.31,34.46 30.25,33.4 | 72.84,41.6 74.09,41.6 74.53,42.05 74.53,45.1 C5.+ 72.4,47.3 73.2,48.1 Q2.2 | 72.84,41.6 67.07,47.37 67.07,47.52 65.92,48.67 64.39,48.67 63.88,49.19 63.88,63.68 64.24,64.04 R9.2 69.16,66.34 R8.2 | 72.84,41.6 72.52,41.29 72.52,35.91 Q1.1 69.6,35.91 69.6,34.59 | 79.28,20.5 R16.2 R17.2 R11.2 | LK6.1 76.24,37.91 78.65,35.5 R10.2 R12.2 78.65,32.5 78.65,27.77 R14.1 | 69.6,33.37 70.69,33.37 Q1.3 | 30.25,33.4 23.48,33.4 22.75,34.13 19.46,34.13 19.46,33.4 19.31,33.4 16.97,31.06 16.97,30.14 | 30.25,33.4 31.31,32.34 31.31,31.5 R5.2 | LK2.3 17.1,49.27 9.76,56.61 C3.2 R1.2 | 18.96,26.52 17.1,28.39 | MB1.3V3 16.39,60.5 IC4.P$5 | 69.6,34.59 69.6,33.37 | Q1.2 69.6,34.63 69.6,34.59
  Bottom 0.635: C5.+ 75.54,50.36 LK6.1 77.25,51.37 83.02,51.37 86.27,48.12 86.27,47.62 LK9.1 | 63.5,15.28 59.88,11.66 59.88,11 CONB.2 57.59,11 57.59,11.64 51.95,17.28 C2.2 | C1.2 63.5,18.37 63.5,15.28 | 63.5,15.28 67.78,11 CONC.1 | LK2.3 18.25,43.5 20.18,41.57 28.33,41.57 28.94,42.18 28.94,42.81 28.25,43.5 LK3.3 | C3.2 12.68,56.79 MB1.3V3 14.39,58.5 IC5.P$3
5V  (via drill 0.3 pad 0.45, 0.3 pad 0.46)
  Top 0.406: IC2.7 16.93,33.4
  Top 0.635: CONA.10 50.43,12.14 62.8,24.52 62.8,61.1 v62.4,61.5 62.4,72.8 65,75.4 IC1.5V | LK9.3 87.41,53.84 88.49,54.92 88.49,58.23 v87.89,58.84 | 16.93,33.4 14.6,31.08 R7.1 11.73,22.81 7.64,18.72 7.64,11.73 8.15,11.22 8.79,11.22 CONJ.1
  Bottom 0.635: CONA.10 49.28,11 49.28,10.36 47.85,8.92 11.1,8.92 9.94,10.08 CONJ.1 | v87.89,58.84 87.89,59.44 85.83,61.5 v62.4,61.5 62.1,61.4 43.04,61.4 40.54,58.9 37.7,58.9 36.5,57.7 MB1.5V
11  (via drill 0.3 pad 0.45)
  Top 0.203: CONA.3 33.58,11 33.58,11.12 34.39,11.93 36,11.93 36.48,11.46 36.48,10.53 41.69,5.31 83.27,5.31 84.85,3.74 88.82,3.74 91.41,6.32 91.41,7.23 90.61,8.03 90.05,8.03 89.25,8.82 89.25,16.78 COND.2 | MB1.TX 38.22,63.51 38.22,54.45 32.96,49.19 v32.35,49.19
  Bottom 0.203: CONI.3 92.91,16.08 90.83,18.16 COND.2 | 12.62,49.19 10.7,47.27 10.7,17.86 18.87,9.68 31.02,9.68 31.72,10.38 31.72,11 CONA.3 | v32.35,49.19 12.62,49.19 | 12.62,49.19 6.32,55.49 6.32,70.75 MB1.BBF1 | MB1.TX 37.73,66.59 62.81,66.59 64.09,65.31 IC1.11 65.95,65.31 67.98,67.34 CONE.4
12
  Top 0.203: CONE.5 98.17,68.95 98.29,68.95 99.49,67.74 99.49,34.22 96.88,31.61 96.69,31.61 94.77,29.69 94.77,20.36 93.96,19.55 93.84,19.55 CONI.4 93.84,17.69 93.96,17.69 94.77,16.88 94.77,9.18 88.97,3.38 84.7,3.38 83.12,4.96 41.54,4.96 36.12,10.38 36.12,11 CONA.4
  Bottom 0.203: MB1.RX 37.37,68.78 63.16,68.78 64.09,67.85 IC1.12 65.95,67.85 67.98,69.88 CONE.5 | CONI.4 92.91,18.62 92.91,18.77 91.52,20.16 COND.1
13  (via drill 0.3 pad 0.45)
  Top 0.203: v78.14,11.9 78.1,11.93 68,11.93 65.04,8.97 40.57,8.97 38.66,10.88 38.66,11 CONA.5 | SD1.P$9 89.81,53.8 94.18,49.43 94.18,39.9 97.08,37 SW2B.P$4 97.48,34.8 SW2A.4 93.84,34.75 | 93.84,34.75 92.98,34.75 SW2A.3 | 93.84,34.75 93.84,22.09 CONI.5
  Bottom 0.203: CONI.5 93.84,20.23 93.96,20.23 94.77,19.42 94.77,15.27 94.64,15.14 90.31,15.14 88.54,13.38 88.54,12.87 87.02,11.36 78.67,11.36 v78.14,11.9 | 97.22,59.72 93.36,59.72 90.81,57.17 SD1.P$9 | CONE.1 97.22,59.72 | 97.22,59.72 97.22,63.02 97.38,63.19 98.35,63.19 99.1,63.94 99.1,70.69 98.96,70.83 66.39,70.83 65.95,70.39 IC1.13 64.09,70.39 57.4,77.08 37.35,77.08 MB1.BBF4
17
  Top 0.203: IC1.17 65.02,46.6 64.9,46.6 63.87,45.57 63.87,19.34 64.77,18.44 65.33,18.44 67.65,16.12 67.65,12.41 | 67.65,12.41 64.57,9.32 42.76,9.32 41.2,10.88 41.2,11 CONA.6 | 79.96,12.41 67.65,12.41 | 79.96,12.41 80.97,13.42 80.97,17.82 81.81,18.66 83.37,18.66 86.23,21.52 DISP2.LED | R18.1 79.96,12.41
19  (via drill 0.3 pad 0.45)
  Top 0.203: IC1.19 39.62,72 39.74,72 62,49.73 v62,39.75
  Bottom 0.203: v62,39.75 62.58,39.17 62.58,38.09 64.44,36.24 66.46,36.24 75.03,27.68 75.03,27.56 LK7.3
20  (via drill 0.3 pad 0.45)
  Top 0.203: v62.1,38.03 61.49,38.65 61.49,41.74 61.65,41.9 61.65,47.55 39.74,69.46 39.62,69.46 IC1.20
  Bottom 0.203: LK8.3 75.03,23.41 75.03,24.16 72.48,26.72 72.48,29.09 65.81,35.76 64.38,35.76 v62.1,38.03
45  (via drill 0.3 pad 0.45)
  Top 0.203: v14.96,18.48 11.82,18.48 11.46,18.12 R19.2 | v35.74,39.22 35.61,39.34 35.42,39.34 R2.1 35.42,43.05 38.69,46.31 38.69,58.49 39.5,59.3 39.62,59.3 IC1.45
  Bottom 0.203: v14.96,18.48 19.66,18.48 35.74,34.55 v35.74,39.22
46  (via drill 0.3 pad 0.45)
  Top 0.203: v73.13,42.3 65.95,49.48 65.95,55.95 65.14,56.76 65.02,56.76 IC1.46 | v82.08,30.79 82.21,30.66 82.76,30.66 R13.2
  Bottom 0.203: v73.13,42.3 73.13,39.74 v82.08,30.79
ANT
  Top 0.381: ANT2.3 PAD5.P$1 ANT1.CTOP ANT1.PC
  Bottom 0.381: LK5.1 25,70.6 | 25,70.6 PAD5.P$1 | 25,70.6 LK4.1
BOOT  (via drill 0.3 pad 0.45)
  Top 0.203: IC1.0 45.5,57.69 v61.13,42.06
  Bottom 0.203: v61.13,42.06 64.21,38.98 69.86,38.98 82.44,26.4 87.73,26.4 88.88,25.25 BOOTA.3 92.98,25.25 93,25.26 95.36,25.26 95.38,25.25 96.4,25.25 | 96.4,25.25 97.48,26.33 BOOTB.P$4 | BOOTA.4 96.4,25.25
BUSY  (via drill 0.3 pad 0.45)
  Top 0.203: v19.48,53.21 18.19,54.5 IC4.P$8
  Bottom 0.203: MB1.BBF2 6.68,68.57 6.68,55.83 10.17,52.34 18.61,52.34 v19.48,53.21 22.77,56.5 IC5.P$15 34.84,54.06 36.79,54.06 37.44,54.71 37.44,55.55 36.71,56.28 36.34,56.28 35.4,57.23 35.4,60.62 36.27,61.49 36.63,61.49 38.69,63.55 38.69,63.65 39.42,64.38 39.62,64.38 IC1.47
DAT1  (via drill 0.3 pad 0.45)
  Top 0.203: v71.32,60.79 70.32,61.8 70.32,68.54 69.46,69.4 69.16,69.4 R8.1 | SD1.P$7 84.73,58.17 84.95,58.39 SD3.DAT1
  Bottom 0.203: SD1.P$7 83.73,57.17 83.73,57.51 82.66,58.58 82.66,59.31 81.18,60.79 v71.32,60.79
DAT2
  Top 0.203: 73.28,56.54 72.91,56.17 71.11,56.17 70.98,56.29 70.98,58.32 69.16,60.14 R9.1 | 73.28,56.54 73.57,56.83 73.57,58.02 73.72,58.17 73.74,58.17 75.04,59.47 75.04,60.93 77.25,63.15 SD3.DAT2 | 73.28,56.54 74.01,55.8 85.28,55.8 86.27,56.79 86.27,57.17 SD1.P$8
DISPCS
  Top 0.203: 78.89,45.76 78.89,53.38 77.21,55.06 71.67,55.06 70.63,56.1 70.63,57.89 69.08,59.44 68.85,59.44 65.95,62.34 65.95,62.77 IC1.10 | 78.89,45.76 78.89,45.02 79.19,44.72 79.29,44.72 83.58,40.43 83.58,37.47 82.76,36.66 R10.1 | 78.89,45.76 83.48,45.76 87.84,41.4 87.84,12.13 86.23,10.52 DISP2.CS
DISPDC
  Bottom 0.203: IC1.6 67.87,37.37 85.02,20.22 85.02,16.81 86.23,15.6 DISP2.DC
DISPMISO
  Top 0.203: DISP2.MISO 86.23,25.76 87.08,26.62 87.08,30.73 86.49,31.32 85.82,31.32 85.38,31.76 85.38,33.36 86.23,34.22 DISP2.TDO
  Bottom 0.203: DISP2.TDO 86.23,35.92 87.08,36.78 87.08,38.35 82.18,43.24 72.17,43.24 65.95,49.46 65.95,50.87 65.14,51.68 65.02,51.68 IC1.8
DISPMOSI  (via drill 0.3 pad 0.45)
  Top 0.203: DISP2.MOSI 86.23,18.14 87.45,19.37 87.45,30.88 86.66,31.68 86.23,31.68 DISP2.TDIN | IC1.9 65.02,59.3 65.14,59.3 65.14,59.31 65.66,59.31 66.48,58.49 66.48,49.47 67.79,48.16 67.79,48.15 72.67,43.27 72.96,43.27 73.8,42.42 v73.8,42.3
  Bottom 0.203: v73.8,42.3 83.57,32.53 DISP2.TDIN
DISPRST
  Top 0.203: DISP2.RST 86.23,13.06 83.82,15.48 83.82,17.5 R17.1
  Bottom 0.203: IC1.18 65.02,49.14 64.9,49.14 60.65,44.89 60.65,41.86 64.21,38.3 67.44,38.3 85.38,20.36 85.38,19.09 85.9,18.56 86.58,18.56 87.09,18.04 87.09,13.93 86.23,13.06 DISP2.RST
DISPSCK
  Top 0.203: DISP2.SCK 86.23,20.68 87.08,21.54 87.08,23.15 86.18,24.06 85.47,24.06 85.38,24.15 85.38,25.74 86.23,26.6 DISP2.TCLK
  Bottom 0.203: IC1.7 69.81,39.91 82.27,27.45 DISP2.TCLK
GND  (via drill 0.3 pad 0.45, 0.5 pad 0.46)
  Top 0.406: IC3.7 24.02,36.32 | 15.65,28.68 IC2.1 15.65,30.86 | IC3.4 26.57,28.68
  Top 0.635: C3.1 10,54.25 13.16,51.08 13.16,43.5 | LK2.1 13.16,43.5 | 18.2,42.09 17.93,42.35 13.67,42.35 13.16,42.86 13.16,43.5 | 18.2,42.09 19.6,43.5 20.88,43.5 LK3.1 | 18.2,36.32 18.2,42.09 | 24.02,36.32 18.2,36.32 | 15.65,9.85 16.68,9.85 20,6.54 CONF.1 20,4.04 19.96,4.04 18.7,2.79 CONF.M1 | Q3.E 15.65,9.85 | 15.65,9.85 15.65,28.68 | 28.35,26.89 26.57,28.68 | 28.35,26.89 36.25,26.89 38.48,24.67 IC1.GND3 39.62,21.19 39.52,21.09 C2.1 | 28.35,26.89 22.77,21.32 IC6.4 | SD3.GND@1 70.9,63.5 70.9,62.23 72.03,61.1 72.03,58.39 SD1.P$2 | CONB.1 57.34,11 57.34,11.64 62.97,17.28 C1.1 | R2.2 31.31,40.5 29.35,42.46 v28.11,42.46 | CONG.2 94.5,62.38 95.14,62.38 96.92,60.6 96.92,57.22 | CONH.M2 96.92,57.22 | 98.13,51.45 CONH.M1 | RESETA.2 97.43,50.76 98.13,51.45 | 96.66,52.92 98.13,51.45 | 96.92,57.22 96.92,53.18 96.66,52.92 | 96.66,52.92 95.67,52.92 CONH.1 93.17,52.92 91.14,54.96 91.14,58.39 89.72,59.8 | CONF.M2 24.3,2.79 30.11,8.6 CONA.2 | SW2B.P$3 90.93,37.05 SW2A.1 93.2,39.25 93.2,44.87 91.57,46.5 RESETB.P$3 88.69,48.7 88.69,48.75 | R13.1 81.19,29.5 81.19,28.71 81.83,28.06 v83.03,28.06 | BOOTA.1 90.88,29.7 BOOTB.P$3 91.52,27.5 93.27,25.75 93.27,24.45 92.69,23.88 92.69,15.19 93.2,14.69 93.84,14.69 CONI.2 | 88.69,48.75 88.66,48.75 88.64,48.77 84.11,48.77 83.4,49.47 | RESETA.1 88.69,48.75 | 83.4,49.47 C6.- | 83.4,49.47 82.58,48.65 C7.2 | ANT1.GT2 27.7,77.8 27.7,78 28.6,78.9 PAD4.P$1 28.91,79.18 PAD3.P$1 | C4.1 90.33,10.55 90.63,10.85 COND.4 | 89.72,59.8 87.58,59.8 87.12,59.35 SD2.GND | 89.72,59.8 90.5,60.59 C8.2 90.5,62.49 89.63,62.49 88.67,63.45 88.67,65.3 SD3.GND@3 | 72.6,67.54 72.6,66.89 v72.6,65.5 | 72.6,67.54 72.6,72.23 71.55,73.28 SD3.GND@2 v71.55,75.3 71.55,76.42 69.96,78.01 IC1.GND
  Top 0.635: SD3.GND@1 v72.6,65.5 | 82.75,66.07 81.92,66.89 81.28,67.54 72.6,67.54 | 86.73,66.85 86.73,72.36 87.65,73.28 SD3.GND@4 87.7,75.1 v87.7,75.3 | SD3.GND 82.75,66.07 | PAD1.P$1 21.11,79.18 PAD2.P$1 | 18.2,36.32 IC2.6 18.2,33.4 15.65,30.86 | ANT1.G1 22.7,75.5 | CONC.2 72.61,11 72.61,10.36 75.84,7.13 DISP2.GND | ANT1.G1 ANT1.GT1 | ANT1.G1 22.6,76 23.5,75.1 23.5,74.4 ANT2.1 17.95,74.13 15.47,71.65 15.47,67.21 16.18,66.5 IC4.P$2 24.94,66.5 24.95,66.49 29.72,66.49 31.73,68.5 IC4.P$16 32.5,71.47 29.89,74.08 26.43,74.08 ANT2.2 26.4,74.2 27.5,75.3 27.5,76.2 ANT1.GT2 | ANT1.G2 27.6,76.3 ANT1.GT2 | CONF.M1 CONF.M2 | MB1.GND2 35.79,54.5 IC4.P$9 | IC1.GND2 IC1.GND1 | 82.75,66.07 83.53,66.85 86.73,66.85 | 86.73,66.85 87.5,66.08 SD3.GND@3 | v18.71,1.43 18.7,1.4 CONF.M1 | CONF.M2 24.3,1.4 v24.33,1.43 | v72.6,65.5 v72.59,65.51 | v72.6,65.5 SD3.GND@1 | v87.54,65.69 87.6,65.7 SD3.GND@3
  Bottom 0.635: CONA.2 30.11,12.14 30.11,14.72 33.86,18.47 38.17,18.47 | LK3.1 23.16,42.35 28,42.35 v28.11,42.46 | 93.2,29.75 95.16,29.75 BOOTA.2 | 92.91,37 93.2,36.71 93.2,29.75 | 92.91,37 95.16,39.25 SW2A.2 | SW2B.P$3 92.91,37 | 93.2,29.75 BOOTA.1 88.66,29.75 87.73,28.82 83.79,28.82 v83.03,28.06 | 19.1,58.45 19.1,59.17 17.77,60.5 IC5.P$4 | 13.57,54.25 14.91,52.91 18.16,52.91 19.1,53.85 19.1,58.45 | 19.1,58.45 29.61,58.45 30.95,59.79 | C6.- 77.97,50.29 C5.- | 38.17,18.47 C2.1 | 38.17,18.47 38.17,16.77 42.8,12.14 53.9,12.14 55.05,11 CONB.1 | 34.37,74.23 34.37,68.1 32.77,66.5 IC5.P$10 IC5.P$11 IC5.P$12 32.25,62.5 30.95,61.2 30.95,59.79 | 30.95,59.79 32.24,58.5 IC5.P$14 33.07,58.5 MB1.GND2 | 13.57,54.25 11.03,54.25 C3.1 9.7,54.6 7.73,56.57 POWER.P$1 | MB1.GND1 13.57,54.25 | 34.37,74.23 34.37,74.83 PAD3.P$1 | C4.1 89.06,9.28 89.06,8.89 87.3,7.13 DISP2.GND | C1.1 64.95,16.01 65.94,16.01 70.33,11.63 70.33,11 CONC.2 | CONE.3 97.03,64.8 95.75,63.53 CONG.2 | 34.37,74.23 37.23,74.23 38.48,75.47 IC1.GND2 | ANT1.G2 ANT1.GT2 | PAD1.P$1 22.46,77.98 ANT1.GT1 ANT1.G1 | COND.4 90.7,14.1 91.26,13.54 CONI.2 | RESETA.1 RESETA.2
  pour Bottom (isolate 0.4): 0,80 100,80 100,0 0,0
GPIO1  (via drill 0.3 pad 0.46)
  Top 0.203: MB1.INT 38.69,68.12 38.69,61.99 39.12,61.56 40.08,61.56 40.83,60.81 v40.83,58.2
  Bottom 0.203: IC1.1 39.62,33.22 39.74,33.22 40.55,34.03 40.55,43.31 39.8,44.06 38.83,44.06 38.33,44.55 38.33,52.99 37.62,53.7 | v40.83,58.2 40.83,57.12 40.47,56.76 39.47,56.76 38.69,55.98 38.69,54.77 37.62,53.7 | 37.62,53.7 33.2,53.7 IC5.P$16 32.08,54.82 28.13,54.82 LK1.2
IO0  (via drill 0.3 pad 0.45)
  Top 0.203: IC6.1 18.96,18.4 19.05,18.4 v21.57,15.87
  Bottom 0.203: v21.57,15.87 21.57,15.27 26.78,10.07 30.91,10.07 31.08,10.24 31.08,11.19 31.82,11.93 41.07,11.93 41.88,11.12 41.88,11 CONA.7
IO1
  Top 0.203: CONA.8 45.35,12.95 39.89,18.41 37.08,18.41 36.28,19.2 33.54,19.2 32.36,18.02 20.61,18.02 20.23,18.4 IC6.2
IO2
  Top 0.203: IC6.3 21.5,18.4 25.2,18.4 26.39,19.58 37.28,19.58 38.1,18.77 40.12,18.77 46.96,11.93 46.96,11 CONA.9
IO3
  Top 0.203: IC6.5 22.77,26.3 23.19,26.3 25.99,29.11 25.99,31.25 26.14,31.4 28.62,31.4 28.7,31.4 29.6,31.4 32.5,28.5 R6.2
LORA_MISO  (via drill 0.3 pad 0.45)
  Top 0.203: 31.15,53.84 31.98,53.02 v32.85,53.02 | 31.15,53.84 31.15,55.15 IC4.P$10 | v27.06,59.16 27.06,57.24 30.46,53.84 31.15,53.84
  Bottom 0.203: MB1.MISO 17.24,62.76 IC5.P$5 23.72,62.5 v27.06,59.16 | v32.85,53.02 37.67,48.19 37.67,42.67 39.5,40.84 39.62,40.84 IC1.41
LORA_MOSI  (via drill 0.3 pad 0.46)
  Top 0.203: 30.67,57.77 29.01,59.43 v27.73,59.43 | IC4.P$11 31.4,58.5 30.67,57.77 | 30.67,57.77 v30.67,54.34
  Bottom 0.203: v27.73,59.43 27.34,59.82 26.99,59.82 22.32,64.5 IC5.P$6 17.03,64.03 13.36,64.03 12.53,63.2 12.53,61.26 MB1.MOSI | IC1.2 39.62,35.76 39.5,35.76 36.91,38.35 36.91,46.94 30.67,53.18 v30.67,54.34
LORA_SCK  (via drill 0.3 pad 0.45)
  Top 0.203: v33.55,51.64 32.08,51.64 26.57,57.16 26.57,59.68 v27.19,60.3 32.3,60.3 IC4.P$12
  Bottom 0.203: MB1.SCK 14.77,66.5 IC5.P$7 20.99,66.5 v27.19,60.3 | IC1.42 39.62,38.3 39.5,38.3 37.27,40.54 37.27,47.92 v33.55,51.64
MMCCMD  (via drill 0.3 pad 0.46)
  Top 0.203: SD2.MOSI 78.43,60.2 79.45,61.22 SD3.MOSI | IC1.38 39.62,46.6 39.5,46.6 36.48,43.57 36.48,37.5 R3.1 35.42,36.34 35.19,36.34 v35.05,36.21
  Bottom 0.203: v35.05,36.21 35.05,34.37 20.51,19.83 DISP2.SDMOSI | SD1.P$5 79.65,58.17 78.75,58.17 78.43,58.5 SD2.MOSI 77.58,59.35 76.72,60.2 71.86,60.2 70.27,58.62 51.64,58.62 40.55,47.53 IC1.38
MMCD0  (via drill 0.3 pad 0.45, 0.3 pad 0.46)
  Top 0.203: v32.94,32.99 33.2,32.99 34.37,31.82 34.37,31.5 R5.1 36.48,31.5 38.69,33.72 38.69,40.71 39.5,41.52 39.62,41.52 IC1.40 40.55,42.45 45.37,47.27 v54.98,47.27 | SD3.MISO 83.85,60.54 83.51,60.2 SD2.MISO 82.66,59.35 81.8,58.5 81.58,58.5 80.86,57.78 80.86,56.52 80.51,56.17 78.74,56.17 78.11,56.79 78.11,57.17 SD1.P$4
  Bottom 0.203: DISP2.SDMISO 22.32,22.37 v32.94,32.99 | SD1.P$4 74.16,54.22 61.92,54.22 v54.98,47.27
MMCSCK  (via drill 0.3 pad 0.46)
  Top 0.203: SD3.SCK 81.65,60.88 80.97,60.2 SD2.SCK 80.12,59.35 79.26,58.5 76.52,58.5 75.57,57.55 75.57,57.17 SD1.P$3 | IC1.39 39.62,44.06 39.5,44.06 37.19,41.74 37.19,35.21 36.48,34.5 R4.1 34.37,34.5 34.37,35.03 v34.24,35.16
  Bottom 0.203: DISP2.SDSCK 14.18,24.91 23.99,24.91 v34.24,35.16 | IC1.39 40.55,44.99 51.73,56.17 72.94,56.17 73.57,56.79 73.57,57.17 SD1.P$3
N$1  (via drill 0.3 pad 0.45)
  Top 0.203: v66.32,28.01 66.97,28.01 Q1.4 73.18,32.09 78.46,26.82 78.46,25.8 78.92,25.34 80.85,25.34 81.71,26.2 81.71,26.5 R14.2 83.82,26.5 83.95,26.64 83.95,42.15 82.58,43.53 C7.1 81.43,44.58 80.73,45.27 v79.37,45.27 | R6.1 36.48,28.5 36.94,28.04 v37.11,28.04 | Q2.1 71.33,50.36 71.33,46.53 71.89,45.97 72.38,45.97 73.48,44.87 v73.53,44.87
  Bottom 0.203: v37.11,28.04 37.22,28.14 66.19,28.14 v66.32,28.01 | v79.37,45.27 73.94,45.27 v73.53,44.87
N$2
  Top 0.203: IC4.P$6 16.13,57.13 16.13,53.95 18.38,51.7 LK1.1
N$3
  Bottom 0.381: IC5.P$9 32.34,69.39 31.25,70.6 LK5.2
N$4
  Top 0.203: LK1.3 22.75,56.5 IC4.P$7
N$6
  Top 0.381: LK4.2 21.7,70.6 21.7,70.58 20.48,70.55 IC4.P$1
N$7
  Top 0.635: D1.C 11.97,48.97 10.86,47.86 10.86,36.44 12.5,34.8 | IC2.8 15.6,34.8 12.5,34.8 | 12.5,34.8 11.7,34 R7.2
N$8
  Top 0.635: POWER.P$2 6.75,71.52 FS1.P$1
N$10
  Top 0.635: SW1.ON 4,58.53 4.86,58.53 8.17,55.22 D1.A
N$11  (via drill 0.5 pad 0.81)
  other vias: 98.31,57.21
N$12  (via drill 0.5 pad 0.81)
  other vias: 98.31,51.63
N$13
  Top 0.203: R19.1 11.46,15.32 13.8,12.99 13.8,12.34 12.71,11.25 Q3.B
N$14
  Bottom 0.635: FS1.P$2 3.3,65.65 2.26,64.61 2.26,59.15 3.14,58.27 4,58.27 SW1.C
N$17
  Top 0.635: CONJ.2 9.94,12.62 9.96,12.65 Q3.C
N$18
  Bottom 0.635: CONE.2 98.17,61.12 98.81,61.12 99.31,60.61 99.31,58.83 98.82,58.33 97.23,58.33 89.16,50.26 89.16,50.16 LK9.2
NRESET  (via drill 0.3 pad 0.46)
  Top 0.203: MB1.RST 14.63,69.32 14.63,67.42 13.77,66.57 13.35,66.57 12.56,65.78 12.56,57.23 13.56,56.23 13.94,56.23 15.25,54.93 15.25,54.33 18.88,50.71 27.95,50.71 28.53,51.29 28.53,52.66 25.86,55.34 25.86,60.16 30.2,64.5 IC4.P$14 33.11,64.5 v33.88,63.73
  Bottom 0.203: IC5.P$13 33.88,61.88 v33.88,63.73 | v33.88,63.73 | IC1.21 37.97,67.85 36.69,66.57 36.26,66.57 33.88,64.19 v33.88,63.73
NSS
  Top 0.203: IC1.14 65.02,73.86 65.14,73.86 65.95,74.67 65.95,76.28 65.83,76.4 43.09,76.4 40.55,73.86 38.8,73.86 37.43,72.5 37.43,72.04 37.17,71.78 36.37,71.78 34.42,69.83 34.42,63.59 33.33,62.5 IC4.P$13 28.71,62.5 26.22,60.01 26.22,56.83 28.89,54.16 28.89,51.14 28.09,50.35 16.93,50.35 11.55,55.73 11.55,59.78 10.06,61.28 9.76,61.28 R1.1 9.76,64.03 MB1.CS
  Bottom 0.203: IC5.P$8 16.84,67.84 MB1.CS
PWR1
  Top 0.635: LK2.2 14.56,44.65 15.73,45.81 DISP1.1
PWR2
  Bottom 0.635: LK3.2 23.41,43.5 23.41,44.14 22.91,44.65 20.75,44.65 18.3,47.1 DISP1.2
RST
  Bottom 0.203: RESETB.P$4 97.48,44.3 RESETA.4 92.98,44.25 RESETA.3 88.88,44.25 88.48,43.85 72.07,43.85 71.24,44.68 71.24,48.1 65.8,53.54 64.2,53.54 60.29,49.63 60.29,35.29 64.9,30.68 65.02,30.68 IC1.RST
RX0
  Top 0.203: CONB.3 60.34,11 60.34,10.88 59.53,10.07 49.62,10.07 49.41,10.27 49.41,19.14 39.74,28.82 39.62,28.82 IC1.44
SCL  (via drill 0.3 pad 0.45)
  Top 0.203: v23.04,10.17 23,10.13 CONF.4 | MB1.SCL 35.41,61.74 35.41,57.27 36.27,56.41 36.58,56.41 37.45,55.54 37.45,54.72 33.26,50.53 32.5,50.53 31.67,49.7 24.38,49.7 22.17,47.49 22.17,47.11 | 22.17,47.11 22.17,46.12 22.95,45.34 22.95,40.76 25.3,38.42 IC3.6 | 22.17,47.11 21.66,47.11 DISP1.SCL | IC6.6 21.5,26.3 20.81,26.3 v19.31,27.8 19.46,27.95 19.46,28.89 IC2.4 | CONG.3 94.5,65.14 94.38,65.14 93.54,64.3 93.54,56.8 CONH.4 | R11.1 82.76,13.34 82.51,13.34 81.75,12.58 81.75,11.21 80.61,10.07 75.75,10.07 74.94,10.88 74.94,11 CONC.3
  Bottom 0.203: 20.77,15.77 20.77,12.43 v23.04,10.17 | 73.42,20.89 33.51,20.89 28.98,16.35 21.36,16.35 20.77,15.77 | 12.48,27.8 12.48,16.59 13.29,15.77 20.77,15.77 | 73.42,20.89 LK8.2 | 73.42,20.89 73.42,12.52 74.01,11.93 CONC.3 | MB1.SCL 36.43,63.84 38.83,66.24 60.55,66.24 62.41,64.38 91.44,64.38 93.13,66.07 CONG.3 | 12.48,27.8 11.08,29.2 11.08,44.29 15.12,48.33 19.17,48.33 19.96,47.54 19.96,47.11 DISP1.SCL | 12.48,27.8 v19.31,27.8
SCL1
  Bottom 0.203: IC1.5 65.95,34.83 71.81,28.97 71.81,25.27 70.88,24.34 LK8.1
SDA  (via drill 0.3 pad 0.45, 0.3 pad 0.46)
  Top 0.203: CONF.3 22,6.32 v22,6.49 22.06,6.55 22.06,16.12 21.51,16.67 21.43,16.67 19.68,18.42 19.68,23.04 20.23,23.6 IC6.7 20.23,25.54 20.23,26.3 20.13,26.3 18.2,28.24 IC2.3 18.2,31.38 18.3,31.38 v18.44,31.53 | MB1.SDA 37.86,58.79 37.86,54.6 33.1,49.84 32.6,49.84 | 32.6,49.84 | 32.6,49.84 32.32,49.84 31.74,49.27 | 31.74,49.27 | 31.74,49.27 30.48,49.27 25.96,44.74 | 25.96,44.74 25.96,36.71 26.57,36.11 IC3.5 | 25.96,44.74 24.44,46.26 23.35,46.26 DISP1.SDA | 93.18,64.36 93.18,55.64 93.91,54.92 CONH.3 | CONG.4 94.5,67.68 94.38,67.68 93.18,66.48 93.18,64.36 | LK7.2 74.35,27.56 74.35,27.44 76.97,24.82 80.68,24.82 81.71,23.8 81.71,23.5 R15.1 | v92.5,64.36 93.18,64.36
  Bottom 0.203: LK7.2 74.35,27.56 74.35,26.75 76.89,24.21 76.89,12.27 76.55,11.93 CONC.4 75.62,11 75.62,10.88 71.23,6.49 v22,6.49 | DISP1.SDA 22.5,47.11 21.64,46.25 20.06,46.25 19.2,47.12 19.2,47.79 19.03,47.96 17.55,47.96 16.63,47.04 16.63,46.28 16.15,45.8 16.15,33.82 v18.44,31.53 | MB1.SDA 38,61.79 41.83,61.79 43.99,63.96 92.09,63.96 v92.5,64.36
SDA1
  Bottom 0.203: IC1.4 65.95,32.29 65.95,31.56 69.95,27.56 LK7.1
SDCS  (via drill 0.3)
  Top 0.203: R20.2 68.21,53.11 68.27,53.17 v68.27,55.14
  Bottom 0.203: DISP2.SDCS 19.96,17.29 34.03,31.36 40.43,31.36 42.2,33.13 42.2,35.17 62.17,55.15 IC1.3 v68.26,55.15 v68.27,55.14
SDCSIN  (via drill 0.3, 0.3 pad 0.45)
  Top 0.203: SD3.CS 78.35,62.66 75.89,60.2 SD2.CS | R12.1 81.71,32.5 81.71,35.82 80.76,36.77 80.6,36.77 78.34,39.02 v78.34,53.21 | v70.4,50.3 68.3,50.3 R20.1
  Bottom 0.203: 78.6,56.17 78.6,57.54 77.94,58.2 75.89,58.2 75.89,58.59 SD2.CS | 78.6,56.17 78.6,53.9 | 78.6,53.9 78.6,53.46 v78.34,53.21 | 78.6,56.17 80.56,56.17 81.19,56.79 81.19,57.17 81.2,57.2 82.1,57.2 SD1.P$6 | v70.4,50.3 73.9,53.8 75.7,53.8 75.8,53.9 78.5,53.9 78.6,53.9
TOUCHCS
  Top 0.203: DISP2.TCS 86.23,29.14 84.54,27.45 84.54,21.23 83.82,20.5 R16.1
  Bottom 0.203: IC1.16 65.02,44.06 64.9,44.06 64.09,43.25 64.09,41.65 64.9,40.84 69.7,40.84 80.55,29.99 DISP2.TCS
TOUCHIRQ
  Bottom 0.203: DISP2.TIRQ 85.38,37.61 84.96,37.19 79.59,37.19 74,42.78 66.28,42.78 65.95,42.45 IC1.15
TX0
  Top 0.203: CONB.4 62.88,11 62.88,10.88 61.7,9.7 49.48,9.7 48.82,10.36 48.82,17.2 39.74,26.28 39.62,26.28 IC1.43
VCCOUT  (via drill 0.3 pad 0.46)
  Top 0.635: 75.42,35.91 75.42,49.31 75.02,49.71 75.02,51.67 LK6.2 75.06,54.08 72.18,54.08 | Q1.8 75.42,35.91 | CONG.1 94.5,59.84 95.95,58.4 95.95,54.32 95.55,53.92 CONH.2 93.67,53.92 91.92,55.67 91.92,62.6 C8.1 | CONI.1 93.84,12.14 93.2,12.14 92.69,12.65 92.69,14.07 90.63,16.14 COND.3 | SD2.VCC 73.35,60.42 74,61.07 74,63.38 74,63.81 76.47,66.28 77.1,66.28 77.11,66.27 80.54,66.27 80.55,66.26 SD3.VCC | v75.9,31.4 75.9,31.98 Q1.5 74.18,32.09 74.18,32.63 74.18,33.4 | 72.18,54.08 71.46,54.08 71.2,54.08 69.49,55.79 SD1.P$1 | Q2.3 72.25,54.01 72.18,54.08 | 75.42,35.91 74.18,35.91 74.18,34.6 | 74.18,34.6 74.18,33.4 | Q1.7 74.18,34.63 74.18,34.6 | Q1.6 74.18,33.37 74.18,33.4
  Bottom 0.635: LK6.2 76.63,52.51 82.3,52.51 C6.+ 85.06,52.79 88.59,56.32 88.59,58.12 91.46,60.99 CONG.1 | v75.9,31.4 75.9,30.82 85.41,21.3 86.64,21.3 88.31,19.63 88.31,18.48 COND.3 | SD1.P$1 70.71,57.17 70.71,58.05 72.01,59.35 SD2.VCC

### Text on the board
tPlace: WARNING | WARNING | - | Connect Antenna Link ! | + | + | ON | RESET | SW2 | BOOT | 050426 | ESP32S3 LoRa Camera Board
bPlace: 050426 | ESP32S3 LoRa Camera Board
tNames: LK4 | LK5 | E | G | ANT | RFM9X | or | SX1262 | SD1 | IC1 | DISP2 | GND | 5V | I
bNames: ANT | SX1280